# Altium schematic sheet led_cc_driver.SchDoc
size 297 x 209 mm
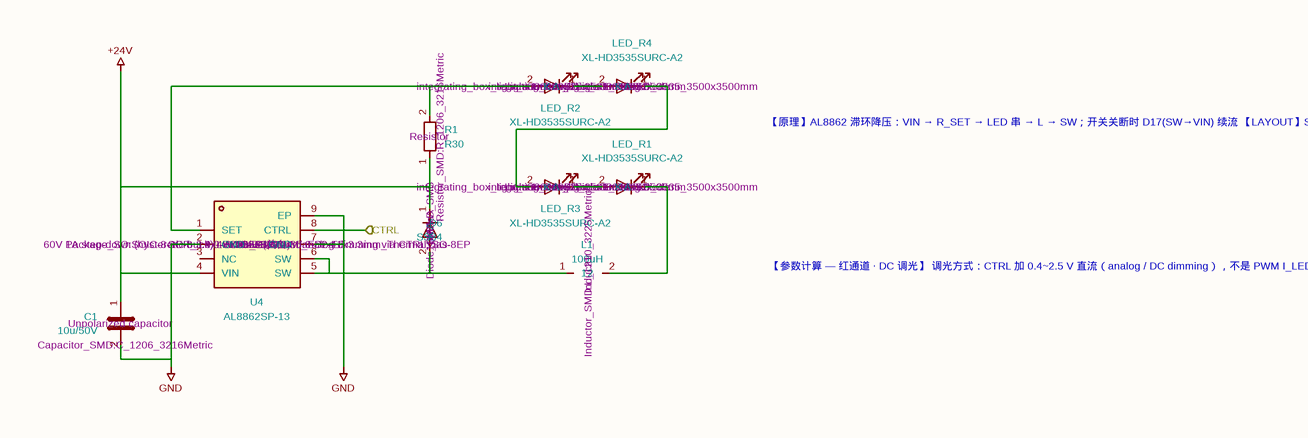
[diagram p0: led_cc_driver.SchDoc]

## Parts
C1  Description: Unpolarized capacitor  Footprint: Capacitor_SMD:C_1206_3216Metric  [C_1206_3216Metric]  (hidden comment: 10u/50V)
D6  Description: Diode  Sim.Pins: 1=K 2=A  Footprint: Diode_SMD:D_SMB  [D_SMB]  (hidden comment: SS34)
L1  Description: Inductor  Footprint: Inductor_SMD:L_1210_3225Metric  [L_1210_3225Metric]  (hidden comment: 100uH)
LED_R1  Description: Light emitting diode  Sim.Pins: 1=K 2=A  LCSC Part: C3646952  Footprint: integrating_box_light_source:LED_3535_3500x3500mm  [LED_3535_3500x3500mm]  (hidden comment: XL-HD3535SURC-A2)
LED_R2  Description: Light emitting diode  Sim.Pins: 1=K 2=A  LCSC Part: C3646952  Footprint: integrating_box_light_source:LED_3535_3500x3500mm  [LED_3535_3500x3500mm]  (hidden comment: XL-HD3535SURC-A2)
LED_R3  Description: Light emitting diode  Sim.Pins: 1=K 2=A  LCSC Part: C3646952  Footprint: integrating_box_light_source:LED_3535_3500x3500mm  [LED_3535_3500x3500mm]  (hidden comment: XL-HD3535SURC-A2)
LED_R4  Description: Light emitting diode  Sim.Pins: 1=K 2=A  LCSC Part: C3646952  Footprint: integrating_box_light_source:LED_3535_3500x3500mm  [LED_3535_3500x3500mm]  (hidden comment: XL-HD3535SURC-A2)
R1  Description: Resistor  Footprint: Resistor_SMD:R_1206_3216Metric  [R_1206_3216Metric]  (hidden comment: R30)
U4  Description: 60V 1A step-down (hysteretic buck) LED driver, PWM/analog dimming via CTRL, SO-8EP  LCSC Part: C526360  Manufacturer: DIODES(美台)  Package: SO-8_L4.9-W3.9-P1.27-LS6.0-BL-EP  Footprint: Package_SO:SOIC-8-1EP_3.9x4.9mm_P1.27mm_EP2.41x3.3mm_ThermalVias  [SOIC-8-1EP_3.9x4.9mm_P1.27mm_EP2.41x3.3mm_ThermalVias]  (hidden comment: AL8862SP-13)

## Ports
CTRL (in)

## Nets
+24V: C1.1 D6.1(K) R1.1 U4.4(VIN)
GND: C1.2 U4.2(GND) U4.7(GND) U4.9(EP)
CTRL: U4.8(CTRL) ; port CTRL
NetD6_2: D6.2(A) L1.1 U4.5(SW) U4.6(SW)
NetL1_2: L1.2 LED_R1.1(K)
NetLED_R1_2: LED_R1.2(A) LED_R3.1(K)
NetLED_R2_1: LED_R2.1(K) LED_R4.2(A)
NetLED_R2_2: LED_R2.2(A) R1.2 U4.1(SET)
NetLED_R3_2: LED_R3.2(A) LED_R4.1(K)

Not connected (* = marked no-connect by the designer): U4 3(NC)

## Notes on the sheet
- 【原理】AL8862 滞环降压：VIN → R_SET → LED 串 → L → SW；开关关断时 D17(SW→VIN) 续流
  【LAYOUT】SW→L/D 走线最短以降低 EMI；EP 大面积铺铜 + 散热过孔；R_SET 与 VIN/SET 用 Kelvin 接法
  【焊接】3535 灯珠回流焊 240±5℃/6s，只建议返修时手工焊（<300℃/3s）
- 【参数计算 — 红通道 · DC 调光】
  调光方式：CTRL 加 0.4~2.5 V 直流（analog / DC dimming），不是 PWM
  I_LED(100%) = 0.1/R_SET = 0.1/0.30 = 333 mA（V_SET 典型 100 mV）
  ΔI = 26 mV/R_SET = 86.6 mA —— 固定值（手册 VSET_HYS = ±13% × 100 mV），调暗时纹波不跟着变小
  V_LED = 4×2.4 V = 9.6 V
  t_OFF = L·ΔI/(V_LED+V_D+I_LED·(R_SET+R_L)) = 100µ×86.6m/10.1 = 857 ns
  t_ON = L·ΔI/(V_IN−V_LED−I_LED·(R_SET+R_L+R_SW)) = 8.66µ/13.6 = 613 ns
  f_SW = 1/(t_ON+t_OFF) = 680 kHz（满载 CCM；调暗到 10% 时 I_avg < ΔI/2 → 进 DCM，频率下降）
  P_R_SET = I²R = 0.033 W；C6 ≥ I(1−D)/(f·ΔV) = 2.9 µF → 10 µF/50V
- 1
- 2
- 3
- 4
- 5
- 6
- A
- B
- C
- 通道：红光 625nm / 4 颗 3535 串联
- IC：AL8862SP-13 (LCSC C526360)，滞环降压恒流
- 灯珠：XL-HD3535SURC-A2 (LCSC C3646952)
- D
- Title: LED 恒流驱动 — 红光通道
- File: led_cc_driver.kicad_sch
- Sheet: /
- integrating_box_light_source
- KiCad E.D.A.  kicad (5.1.4)-1
- Size: A4
- Date: 2026-11-08
- Rev: A
- Id: 1/1

## Library data of the parts
C1 = C: Value: 10u/50V
D6 = D: Sim.Device: D; Value: SS34
L1 = L: Value: 100uH
LED_R1-LED_R4 = LED: Value: XL-HD3535SURC-A2
R1 = R: Value: R30
U4 = AL8862SP-13: MPN: AL8862SP-13; Value: AL8862SP-13